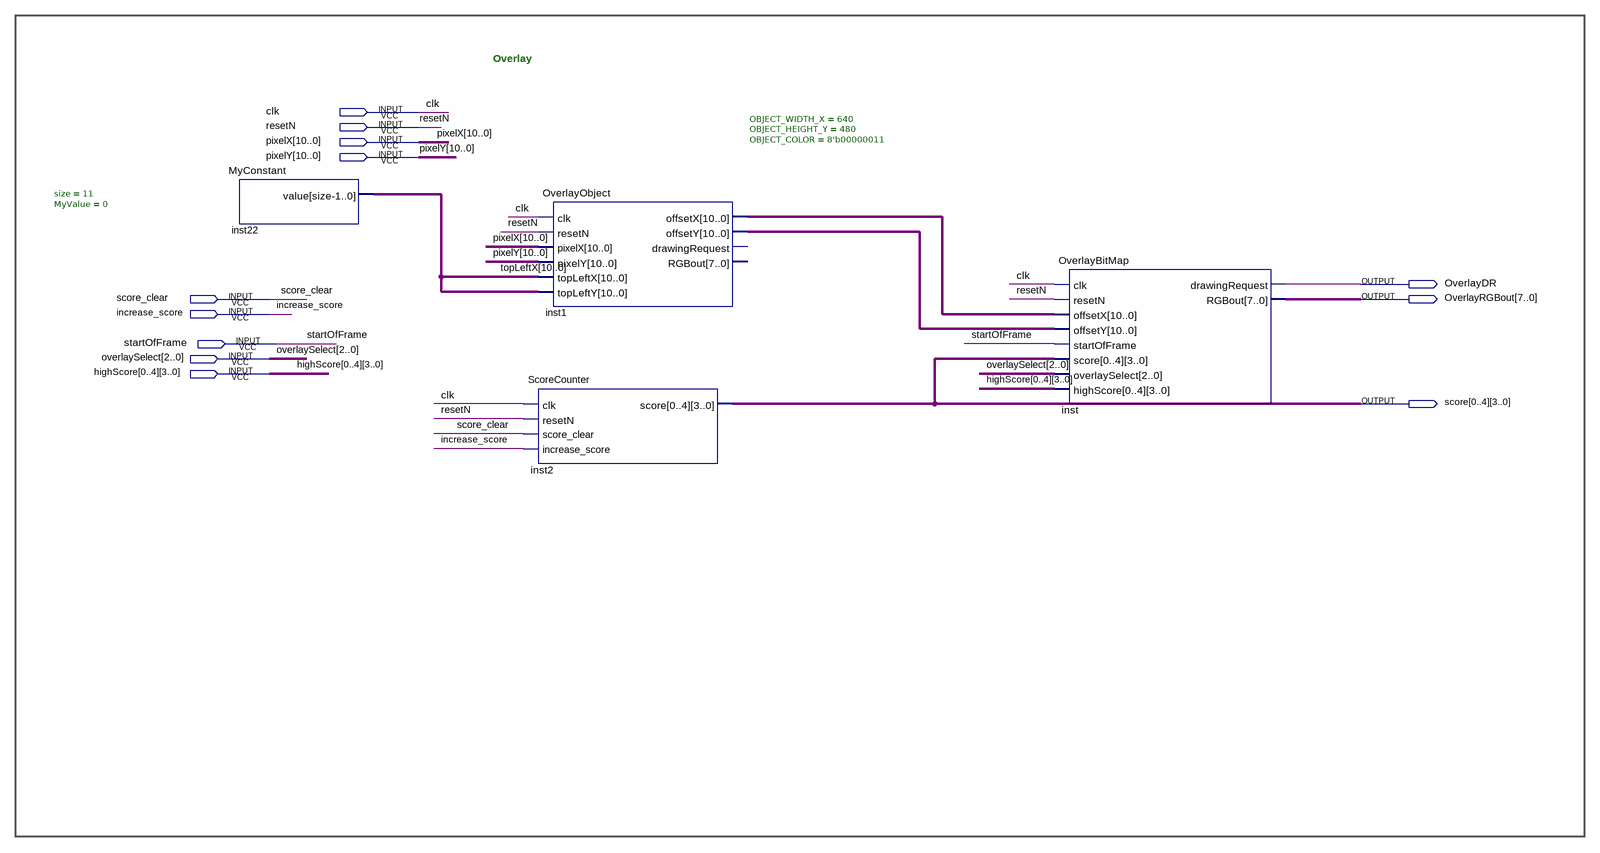
[diagram p0: schematic sheet]
// Quartus schematic Overlay_TOP.bdf as structural Verilog: 4 symbols, 12 pins
module Overlay_TOP (
  input  clk,
  input  resetN,
  input  [10:0] pixelX,
  input  [10:0] pixelY,
  input  score_clear,
  input  increase_score,
  input  startOfFrame,
  input  [2:0] overlaySelect,
  input  [3:0] highScore_0,
  input  [3:0] highScore_1,
  input  [3:0] highScore_2,
  input  [3:0] highScore_3,
  input  [3:0] highScore_4,
  output OverlayDR,
  output [7:0] OverlayRGBout,
  output [3:0] score_0,
  output [3:0] score_1,
  output [3:0] score_2,
  output [3:0] score_3,
  output [3:0] score_4
);

  wire [10:0] inst1_offsetx, inst1_offsety, topLeftX;

  MyConstant #(.size(11), .MyValue(0)) inst22 (.value(topLeftX));
  ScoreCounter inst2 (
    .clk(clk), .resetN(resetN), .score_clear(score_clear), .increase_score(increase_score),
    .score({score_0, score_1, score_2, score_3, score_4}));
  OverlayObject #(.OBJECT_WIDTH_X(640), .OBJECT_HEIGHT_Y(480), .OBJECT_COLOR(8'b00000011)) inst1 (
    .clk(clk), .resetN(resetN), .pixelX(pixelX), .pixelY(pixelY), .topLeftX(topLeftX), .topLeftY(topLeftX),
    .offsetX(inst1_offsetx), .offsetY(inst1_offsety));  // open: drawingRequest, RGBout
  OverlayBitMap inst (
    .clk(clk), .resetN(resetN), .offsetX(inst1_offsetx), .offsetY(inst1_offsety),
    .startOfFrame(startOfFrame), .score({score_0, score_1, score_2, score_3, score_4}),
    .overlaySelect(overlaySelect),
    .highScore({highScore_0, highScore_1, highScore_2, highScore_3, highScore_4}),
    .drawingRequest(OverlayDR), .RGBout(OverlayRGBout));

  // Notes on the sheet:
  //   Overlay
endmodule
